# EasyEDA Pro project esp32s3clock.epro, board PCB2
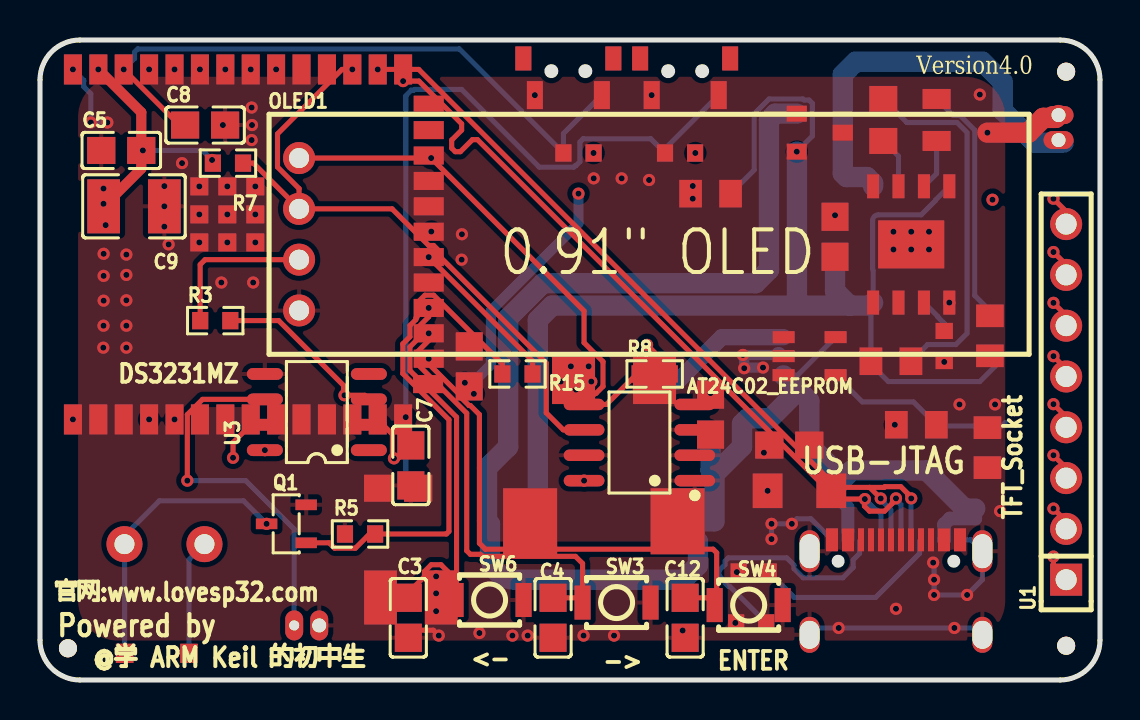
[diagram p7: board, top side]
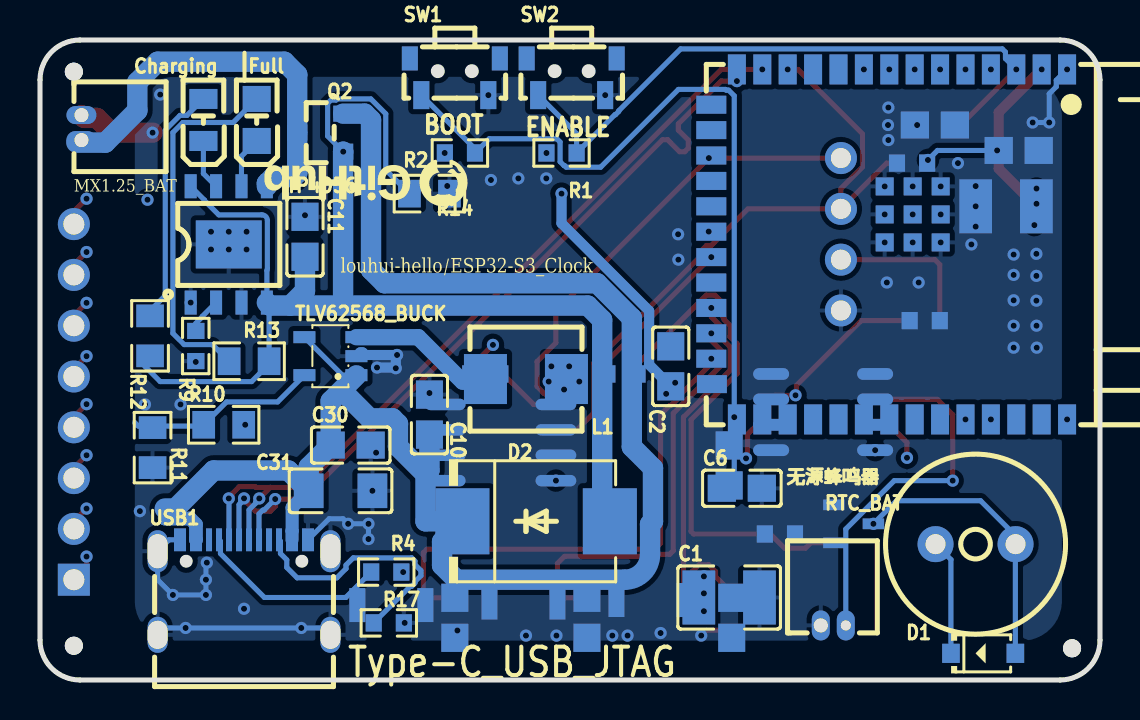
[diagram p8: board, bottom side, seen from below]

Outline 53 x 32 mm; copper layers: Top Layer, Inner1, Inner2, Bottom Layer. Coordinates in mm from the lower left corner of the outline.
Outline path: 0,30 0,2 arc(0.59,0.59) 2,0 51,0 arc(52.41,0.59) 53,2 53,30 arc(52.41,31.41) 51,32 2,32 arc(0.59,31.41) 0,30
Stack: Top Layer 0.035mm Outer layer thickness 1oz / Dielectric1 0.2104mm 7628 RC49% 8.6mil er 4.4 / Inner1 0.0152mm Inner layer thickness / Dielectric2 1.065mm 1.1mm H/HOZ Copper er 4.43 / Inner2 0.0152mm Inner layer thickness / Dielectric3 0.2104mm 7628 RC49% 8.6mil er 4.4 / Bottom Layer 0.035mm Outer layer thickness 1oz

## Design rules (mm)
net D+: DP1
net D-: DP1
spacing copperThickness1oz (default): track to track 0.102, other pairs 0.152 to 0.3
spacing copperThickness2oz: track to track 0.203, other pairs 0.152 to 0.3
track width copperThickness1oz (default): min 0.127, default 0.254, max 2.54
track width copperThickness2oz: min 0.203, default 0.254, max 2.54
differential pair differentialPair (default): width min 0.127, default 0.254, max 2.54; gap min 0.152, default 0.152
net GND uses copperRegion
net 3.3V uses copperRegion

## Placement (name value [footprint] x y rotation side)
AT24C02_EEPROM  AT24C02  [SOP-8_L5.0-W4.0-P1.27-LS6.0-BL]  29.97 11.87 90 top
C1  22uF  [C1210]  18.54 4.13 180 bottom
C2  100nF  [C0805]  21.46 15.68 90 bottom
C3  100nF  [C0805]  18.42 3.11 90 top
C4  100nF  [C0805]  25.65 3.11 90 top
C5  100nF  [C0805]  4.06 26.48 0 top
C6  100nF  [C0805]  17.91 9.59 180 bottom
C7  100nF  [C0805]  18.54 10.73 270 top
C8  100nF  [C0805]  8.26 27.75 0 top
C9  22uF  [C1210]  4.7 23.68 0 top
C10  10uF  [C0805]  33.53 13.27 270 bottom
C11  10uF  [C0805]  39.75 22.16 270 bottom
C12  100nF  [C0805]  32.26 3.11 90 top
C30  100nF  [C0805]  37.47 11.75 180 bottom
C31  22uF  [C1206]  37.97 9.46 180 bottom
Charging  GL0805UR01  [LED0805-R-RD_RED]  44.83 28 90 bottom
D1  1N4148W  [SOD-123_L2.7-W1.6-LS3.7-FD]  5.84 1.33 0 bottom
D2  SS34  [SMC_L6.9-W5.9-LS7.9-RD]  28.19 7.94 180 bottom
Full  GL0805UG01  [LED0805-FD_GL0805UG01]  42.16 28 270 bottom
L1  DH0520H-2R2M  [IND-SMD_L5.6-W5.2_MST0530H-150M]  28.7 15.05 0 bottom
MX1.25_BAT  ZX-MX1.25-2PWZ  [CONN-TH_2P-P1.25_ZX-MX1.25-2PWZ]  50.93 27.62 90 bottom
NOREF  -  [Pad_e538]  1.4 1.59 0 top
NOREF#2  -  [Pad_e539]  51.31 1.71 0 top
NOREF#3  -  [Pad_e540]  51.31 30.42 0 top
OLED1  HS91L02W2C01  [OLED-TH_L38.0-W12.0_HS91L02W2C01]  12.95 22.29 0 top
Q1  S8050  [SOT-23-3_L2.9-W1.3-P1.90-LS2.3-BR]  12.32 7.81 0 top
Q2  AO3401A  [SOT-23_L2.9-W1.3-P1.90-LS2.4-BR]  38.99 27.37 180 bottom
R1  10kΩ  [R0603]  26.92 26.35 180 bottom
R2  10kΩ  [R0603]  32 26.35 180 bottom
R3  10kΩ  [R0603]  8.76 17.97 0 top
R4  5.1kΩ  [R0603]  35.69 5.4 0 bottom
R5  10kΩ  [R0603]  16 7.3 0 top
R7  4.7kΩ  [R0603]  9.4 25.84 180 top
R8  4.7kΩ  [R0603]  30.73 15.3 0 top
R9  2.4kΩ  [R0603]  45.21 16.7 90 bottom
R10  100kΩ  [R0805]  43.82 12.76 180 bottom
R11  22kΩ  [R0805]  47.37 11.62 270 bottom
R12  1kΩ  [R0805]  47.5 17.21 270 bottom
R13  1kΩ  [R0805]  42.55 15.94 180 bottom
R14  100kΩ  [R0805]  33.53 24.32 0 bottom
R15  1kΩ  [R0603]  23.88 15.3 180 top
R17  5.1kΩ  [R0603]  35.56 2.86 0 bottom
RTC_BAT  ZX-MX1.25-2PWZ  [CONN-TH_2P-P1.25_ZX-MX1.25-2PWZ#2]  13.33 2.73 0 bottom
SW1  TS24CA 250gf 013  [SW-SMD_L4.7-W3.5-P3.35-EH]  32.26 30.16 180 bottom
SW2  TS24CA 250gf 013  [SW-SMD_L4.7-W3.5-P3.35-EH]  26.42 30.16 180 bottom
SW3  B3U-1000P  [KEY-SMD_B3U-1000PM]  28.83 3.87 0 top
SW4  B3U-1000P  [KEY-SMD_B3U-1000PM]  35.43 3.75 0 top
SW6  B3U-1000P  [KEY-SMD_B3U-1000PM]  22.48 4 0 top
TLV62568_BUCK  TLV62568DBVR  [SOT-23-5_L3.0-W1.7-P0.95-LS2.8-BR]  38.48 16.19 180 bottom
TP4056  TP4056  [ESOP-8_L4.9-W3.9-P1.27-LS6.0-BL-EP]  43.56 21.78 180 bottom
U1  LAIL-PM2.54-8P-L  [HDR-TH_LAIL-PM2.54-8P-L]  51.31 13.91 90 top
U2  2.4GHz  [WIRELM-SMD_ESP32-S3-WROOM-1]  10.54 21.78 270 bottom
U3  DS3231MZ+TRL  [SOIC-8_L4.9-W3.9-P1.27-LS6.0-BL]  13.84 13.4 90 top
USB1  LAIL-TYPE-C-16PIN-08-WT  [TYPE-C-SMD_LAIL-TYPE-C-16PIN-08-WT]  42.8 4.63 180 bottom
无源蜂鸣器  2.7kHz  [BUZ-TH_BD9.0-P4.00-D0.6-FD]  6.22 6.79 180 bottom

## Footprints (pads in the part's own frame, mm; a bottom-side part is the same pattern mirrored in y, then rotated)
BUZ-TH_BD9.0-P4.00-D0.6-FD
  round 1.8 hole 1: 1(-2,0) 2(2,0)
C0805
  rect 1.41x1.35 hole 0.001: 1(-1,0) 2(1,0)
C1206
  rect 1.485x1.728 hole 0.001: 1(-1.593,0) 2(1.593,0)
C1210
  rect 1.635x2.7 hole 0.001: 1(-1.518,0) 2(1.518,0)
CONN-TH_2P-P1.25_ZX-MX1.25-2PWZ
  oval 0.9x1.5 hole 0.7: 1(-0.625,0) 2(0.625,0)
CONN-TH_2P-P1.25_ZX-MX1.25-2PWZ#2
  oval 0.9x1.5 hole 0.5: 1(-0.625,0)
  oval 0.9x1.5 hole 0.7: 2(0.625,0)
ESOP-8_L4.9-W3.9-P1.27-LS6.0-BL-EP
  rect 0.6x1.2 hole 0.001: 1(-1.905,-2.909) 2(-0.635,-2.909) 3(0.635,-2.909) 4(1.905,-2.909) 5(1.905,2.909) 6(0.635,2.909) 7(-0.635,2.909) 8(-1.905,2.909)
  rect 3.3x2.4 hole 0.001: 9(0,0)
HDR-TH_LAIL-PM2.54-8P-L
  rect 1.6x1.6 hole 1.05: 1(-8.89,0)
  round 1.6 hole 1.05: 2(-6.35,0) 3(-3.81,0) 4(-1.27,0) 5(1.27,0) 6(3.81,0) 7(6.35,0) 8(8.89,0)
IND-SMD_L5.6-W5.2_MST0530H-150M
  rect 2.15x2.5 hole 0.001: 1(-2.025,0) 2(2.025,0)
KEY-SMD_B3U-1000PM
  rect 0.8x1.7 hole 0.001: 1(-1.7,0) 2(1.7,0)
LED0805-FD_GL0805UG01
  rect 1.3x1.399 hole 0.001: 1(-1.05,0) 2(1.05,0)
LED0805-R-RD_RED
  rect 1x1.399 hole 0.001: 1(1.05,0) 2(-1.05,0)
OLED-TH_L38.0-W12.0_HS91L02W2C01
  round 1.6 hole 1: 1(0,-3.81) 2(0,-1.27) 3(0,1.27) 4(0,3.81)
Pad_e538
  round 0.9 hole 1.7: 1(0,0)
Pad_e539
  round 0.9 hole 1.7: 1(0,0)
Pad_e540
  round 0.9 hole 1.7: 1(0,0)
R0603
  rect 0.806x0.864 hole 0.001: 1(-0.753,0) 2(0.753,0)
R0805
  rect 1.133x1.377 hole 0.001: 1(-1,0) 2(1,0)
SMC_L6.9-W5.9-LS7.9-RD
  rect 2.7x3.3 hole 0.001: 1(-3.687,0) 2(3.687,0)
SOD-123_L2.7-W1.6-LS3.7-FD
  rect 0.88x0.96 hole 0.001: 1(-1.61,0) 2(1.61,0)
SOIC-8_L4.9-W3.9-P1.27-LS6.0-BL
  oval 0.588x1.8 hole 0.001: 1(-1.905,-2.6) 2(-0.635,-2.6) 3(0.635,-2.6) 4(1.905,-2.6) 5(1.905,2.6) 6(0.635,2.6) 7(-0.635,2.6) 8(-1.905,2.6)
SOP-8_L5.0-W4.0-P1.27-LS6.0-BL
  oval 0.574x2.035 hole 0.001: 1(-1.905,-2.768) 2(-0.635,-2.768) 3(0.635,-2.768) 4(1.905,-2.768) 5(1.905,2.768) 6(0.635,2.768) 7(-0.635,2.768) 8(-1.905,2.768)
SOT-23-3_L2.9-W1.3-P1.90-LS2.3-BR
  rect 1.07x0.532 hole 0.001: 1(0.99,-0.95) 2(0.99,0.95) 3(-0.99,0)
SOT-23-5_L3.0-W1.7-P0.95-LS2.8-BR
  rect 1.1x0.6 hole 0.001: 1(1.3,-0.95) 2(1.3,0) 3(1.3,0.95) 4(-1.3,0.95) 5(-1.3,-0.95)
SOT-23_L2.9-W1.3-P1.90-LS2.4-BR
  rect 1x0.8 hole 0.001: 1(1.15,-0.95) 2(1.15,0.95) 3(-1.15,0)
SW-SMD_L4.7-W3.5-P3.35-EH
  rect 0.8x1.4 hole 0.001: 1(-1.675,-0.917) 2(1.675,-0.917)
  rect 0.8x1.2 hole 0.001: 3(-2.25,0.917) 4(2.25,0.917)
TYPE-C-SMD_LAIL-TYPE-C-16PIN-08-WT
  oval 1x2.1 hole 1x1.7: 13(4.32,1.805) 16(-4.32,1.805)
  oval 1x1.8 hole 1x1.4: 14(4.32,-2.375) 15(-4.32,-2.375)
  rect 0.6x1.14 hole 0.001: A1B12(-3.2,2.375) A4B9(-2.4,2.375) B1A12(3.2,2.375) B4A9(2.4,2.375)
  rect 0.3x1.14 hole 0.001: A5(-1.25,2.375) A6(-0.25,2.375) A7(0.25,2.375) A8(1.25,2.375) B5(1.75,2.375) B6(0.75,2.375) B7(-0.75,2.375) B8(-1.75,2.375)
WIRELM-SMD_ESP32-S3-WROOM-1
  rect 1.5x0.9 hole 0.001: 1(-8.75,8.895) 2(-8.75,7.625) 3(-8.75,6.355) 4(-8.75,5.085) 5(-8.75,3.815) 6(-8.75,2.545) 7(-8.75,1.275) 8(-8.75,0.005) 9(-8.75,-1.265) 10(-8.75,-2.535) 11(-8.75,-3.805) 12(-8.75,-5.075) 13(-8.75,-6.345) 14(-8.75,-7.615) 27(8.75,-7.615) 28(8.75,-6.345) 29(8.75,-5.075) 30(8.75,-3.805) 31(8.75,-2.535) 32(8.75,-1.265) 33(8.75,0.005) 34(8.75,1.275) 35(8.75,2.545) 36(8.75,3.815) 37(8.75,5.085) 38(8.75,6.355) 39(8.75,7.625) 40(8.75,8.895)
  rect 0.9x1.5 hole 0.001: 15(-6.985,-8.895) 16(-5.715,-8.895) 17(-4.445,-8.895) 18(-3.175,-8.895) 19(-1.905,-8.895) 20(-0.635,-8.895) 21(0.635,-8.895) 22(1.905,-8.895) 23(3.175,-8.895) 24(4.445,-8.895) 25(5.715,-8.895) 26(6.985,-8.865)
  rect 0.9x0.9 hole 0.001: 41(-2.9,-0.225) 41(-2.9,1.175) 41(-2.9,2.575) 41(-1.5,-0.225) 41(-1.5,1.175) 41(-1.5,2.575) 41(-0.1,-0.225) 41(-0.1,1.175) 41(-0.1,2.575)

## Nets
As in the schematic.

Pads without a net: NOREF 1; NOREF#2 1; NOREF#3 1; SW1 3 4; SW2 3 4; U2 10 11 15 16 18 19 22 26 28 29 30 31 32 33 34 35 38 39; U3 1 4; USB1 A8 B8

## Via types
v1: diameter 0.61, hole 0.305, Top Layer to Bottom Layer, 143 vias

## Routing (per net, layer and track width the routed paths; a pad name or vN(x,y) marks a point on that pad's centre or on a via; arc(x,y) is an arc through that point)
3.3V: length 51.4
  Top Layer w0.254: OLED1.2 8.26,21.02 8.01,20.77 R3.1 ; v1(50.67,21.4) 51.31,20.76 U1.7 ; 17.75,11.08 17.89,11.08 C7.1 ; 17.75,11.08 17.62,11.21 17.62,12.29 17.14,12.76 U3.2 ; 17.75,11.08 v1(17.7,11.08) ; v1(3.28,22.75) 3.28,23.7 v1(3.18,23.81) v1(3.18,24.57) ; 31.37,15.17 31.37,15.74 v1(30.35,16.76)
  Top Layer w0.508: C9.1 3.24,23.74 5.06,25.57 C5.2 5.06,28.38 v1(2.92,30.53)
  Inner2 w0.254: v1(47.63,24.01) 47.85,23.79 48.79,23.79 49.18,23.4 49.18,22.46 49.42,22.22 49.59,22.22 50.42,21.4 v1(50.67,21.4)
  Bottom Layer w0.254: D1.2 7.45,6.02 无源蜂鸣器.1 ; v1(8.6,26) 8.13,26.48 v1(5.14,26.48)
  Bottom Layer w0.508: v1(26.92,24.32) 26.92,22.84 22.54,18.46 22.54,15.76 C2.1
  vias: v1(19.81,5.18) v1(19.81,4.33) v1(19.81,3.44) v1(21.24,14.86) v1(21.69,14.31) v1(26.04,14.92) v1(26.54,15.68) v1(26.8,14.52) v1(27.2,9.97) v1(27.43,15.68) v1(27.57,14.92) v1(27.68,26.35) v1(32.77,26.35) v1(42.74,12.76)
GND: length 39.7
  Top Layer w0.254: v1(19.94,2.22) 19.67,2.49 18.54,2.49 ; v1(50.67,24.07) 51.31,23.43 U1.8
  Top Layer w1.016: MX1.25_BAT.2 50.79,28.11 50.17,28.11 49.43,27.37 v1(47.37,27.37)
  Inner2 w0.254: v1(47.37,27.37) v1(50.67,24.07)
  Bottom Layer w0.254: USB1.15 46.78,2.6 v1(45.72,2.6) v1(39.94,2.6) 38.82,2.6 USB1.14 ; v1(1.65,30.53) 2.19,29.99 2.19,29.66 2.54,29.31 v1(2.54,27.88) v1(3.37,27.88) ; v1(36.58,7.05) v1(36.58,7.81) v1(37.59,7.81) 37.85,8.06 38.55,8.06 USB1.B1A12 ; v1(44.66,5.87) 44.7,5.82 v1(44.7,5.02) v1(44.7,4.25) v1(46.36,4.25) 47.12,5.02 USB1.16 46.55,7.01 USB1.A1B12
  Bottom Layer w0.508: v1(36.15,15.62) 35.24,15.62 v1(35.21,15.59) 35.21,16.19 v1(35.15,16.25) 36.74,16.25 36.86,16.38 36.99,16.38 TLV62568_BUCK.2
  vias: v1(1.65,13.03) v1(3.18,21.31) v1(3.18,20.21) v1(3.18,18.97) v1(3.18,17.72) v1(3.16,16.62) v1(4.32,21.27) v1(4.32,20.26) v1(4.32,18.98) v1(4.32,17.72) v1(4.32,16.62) v1(6.22,24.69) v1(6.22,23.68) v1(6.22,22.67) v1(6.43,21.78) v1(7.1,25.84) v1(7.97,24.68) v1(7.97,23.28) v1(7.97,21.88) v1(9.14,27.75) v1(9.07,19.87) v1(9.37,24.68) v1(9.37,23.28) v1(9.37,21.88) v1(10.58,28.62) v1(10.6,27.75) v1(10.58,27) v1(10.66,19.87) v1(10.77,24.68) v1(10.77,23.28) v1(10.77,21.88) v1(21.1,22.29) v1(21.08,21.02) v1(21.97,2.35) v1(23.62,2.22) v1(24.38,2.22) v1(24.74,29.24) v1(27.18,2.22) v1(27.69,25.08) v1(28.7,2.22) v1(29.08,25.08) v1(30.45,25) v1(30.58,29.24) v1(32.13,2.48) v1(32.64,24.7) v1(32.64,24.07) v1(33.53,14.35) v1(34.84,5.4) v1(34.77,2.86) v1(36.2,11.37) v1(36.38,9.46) v1(39.75,23.24) v1(42.67,22.41) v1(42.67,21.53) v1(42.8,3.56) v1(43.56,22.41) v1(43.56,21.53) v1(44.45,22.41) v1(44.45,21.53) v1(45.21,15.9) v1(45.47,18.87) v1(45.97,13.78) v1(46.99,29.27) v1(47.75,13.78) v1(48.01,8.44)
VBUS: length 67.1
  Bottom Layer w0.254: 47.75,16.21 47.75,15.68 46.99,14.92 42.42,14.92 41.55,15.79 R13.2 41.55,18.76 ; TP4056.4 41.66,20.47 arc(41.64,20.52) 41.63,20.58 41.63,22.98 arc(41.71,23.18) 41.91,23.26 44.06,23.26 44.78,23.97 44.78,24 TP4056.8 ; v1(37.84,26.42) 38.62,27.2 38.62,28.83 38.45,29 38.2,29 38.14,29.05 36.46,29.05 35.71,28.31 35.71,25.5 R14.2
  Bottom Layer w1.016: 40.48,18.72 39.75,19.45 C11.2 ; 40.48,18.72 25.61,18.72 24.89,18 24.89,8.32 D2.2 ; 40.48,18.72 41.51,18.72 41.55,18.76 TP4056.4 ; 37.85,18.98 37.85,26.41 v1(37.84,26.42)
VIN: length 86.3
  Bottom Layer w0.254: TLV62568_BUCK.1 37.88,15.24 TLV62568_BUCK.4
  Bottom Layer w0.65: USB1.B4A9 40.4,7.45 40.39,7.45 40.39,8.63 C31.1
  Bottom Layer w0.686: 46.76,8.57 46.76,8.07 45.49,8.07 45.2,7.78 45.2,7.01 USB1.A4B9
  Bottom Layer w1.016: 33.72,10.29 33.53,10.49 C10.2 ; 33.72,10.29 35.1,11.67 35.1,12.81 35.37,13.08 36.51,13.08 37.72,14.29 ; 33.72,10.29 33.72,7.94 D2.1 32.9,6.92 32.9,5.73 32.18,5.02 23.77,5.02 arc(22.87,5.39) 22.5,6.29 22.5,7.79 22.35,7.94 22.35,10.6 23.41,11.66 23.41,18.1 25.15,19.84 35.78,19.84 36.45,20.51 36.45,28 36.76,28.32 Q2.2 ; 37.18,15.23 38.47,13.95 C30.1 39.57,10.65 C31.1 40.58,10.48 44.32,10.48 46.23,8.57 46.76,8.57
BAT_IN: length 18.7
  Top Layer w0.254: v1(7.37,9.97) 7.37,13.27 8.13,14.03 U3.6
  Bottom Layer w0.254: v1(7.37,9.97) 10.29,9.97 12.71,7.55 RTC_BAT.1
BL: length 77
  Top Layer w0.254: U1.1 50.67,5.65 v1(50.67,6.17)
  Inner2 w0.254: v1(50.67,6.17) 50.5,6.35 50.23,6.35 49.59,6.98 49.59,9.02 38.73,19.88 24.58,19.88 20.17,15.47 20.17,15.15 19.78,14.77 18.09,14.77 13.5,10.17 8.76,10.17 6.14,12.79 6.14,13.27 5.63,13.78 5.63,24.94 6.16,25.47 6.16,26.23 6.37,26.44 6.37,30.06 5.9,30.53 v1(5.46,30.53)
BOOT: length 40
  Bottom Layer w0.254: C6.1 18.29,10.21 v1(18.29,13.14) 18.29,29.21 18.57,29.49 18.69,29.49 18.73,29.53 21.08,29.53 24.97,25.64 26.69,25.64 26.77,25.72 26.8,25.72 27,25.91 27,26.9 27.16,27.06 30.54,27.06 R2.2 31.25,26.56 SW1.1
BUZZER: length 14.4
  Bottom Layer w0.254: D1.1 4.23,6.78 4.01,7 5.97,8.96 10.18,8.96 v1(11.33,7.81)
BUZZER_PWM: length 26.6
  Top Layer w0.254: R15.2 23.12,15.8 19.69,19.24 19.25,19.24 18.85,18.85 18.85,18.15 18.8,18.1 18.8,18.02 18.5,17.72 18.5,17.16 18.14,16.81 18.14,15.32 20.45,13.02 20.45,7.43 20.32,7.3 R5.2 16.48,7.3 15.77,6.59 14.73,6.59 14.46,6.86 Q1.1
CLK: length 48.2
  Top Layer w0.254: U1.6 51.31,18.22 v1(50.67,18.86)
  Inner2 w0.254: 50.67,17.59 48.82,19.44 48.82,23.25 48.64,23.43 40.38,23.43 39.99,23.82 39.51,23.82 39.12,23.43 21.34,23.43 14.24,30.53 v1(11.81,30.53)
CS: length 77.9
  Top Layer w0.254: U1.2 51.31,7.94 v1(50.67,8.57)
  Inner2 w0.254: v1(6.73,30.53) 6.73,26.29 6.52,26.09 6.52,25.6 7.02,25.11 7.02,13.71 9.07,11.66 9.07,10.87 9.41,10.53 11.1,10.53 11.83,11.25 11.83,11.6 13.93,13.7 14.69,12.94 15.76,12.94 17.94,15.12 19.63,15.12 19.81,15.3 19.81,15.61 21.64,17.44 21.64,20.03 22.5,20.89 40.64,20.89 41.64,19.9 42.94,19.9 46.81,16.02 46.81,12.3 50.54,8.57 v1(50.67,8.57)
D+: length 40.6
  Top Layer w0.254: v1(42.8,9.08) 42.62,8.9 42.62,8.84 42.23,8.44 41.48,8.44 41.22,8.7 41.22,9.03 v1(41.24,9.05) 39.84,9.05 21.87,27.02 21.62,27.02 21.02,26.41 20.76,26.41 20.58,26.59 20.58,27 21.08,27.49 21.08,27.81 18.95,29.95 v1(18.16,29.95)
  Bottom Layer w0.254: USB1.A6 43.05,8.77 42.98,8.84 42.98,8.9 v1(42.8,9.08) ; v1(41.24,9.05) 41.8,8.49 41.86,8.49 42.05,8.31 USB1.B6
D-: length 40.8
  Top Layer w0.254: 41.48,9.63 42.21,9.63 42.24,9.67 43.04,9.67 43.38,9.32 43.38,9.26 v1(43.56,9.08) ; 41.48,9.63 39.83,9.63 18.94,30.53 v1(16.89,30.53) ; 41.48,9.63 v1(42.04,9.08)
  Bottom Layer w0.254: USB1.B7 43.55,9.07 v1(43.56,9.08) ; v1(42.04,9.08) 42.22,8.9 42.22,8.84 42.55,8.51 USB1.A7
DC: length 75.7
  Top Layer w0.254: U1.3 51.31,10.6 v1(50.67,11.24)
  Inner2 w0.254: v1(50.67,11.24) 50.04,11.24 49.24,12.04 49.24,14.71 47.17,16.77 47.17,20.08 46.99,20.26 41.78,20.26 40.77,21.27 22.16,21.27 21.32,20.43 20.24,20.43 17.14,17.33 16.96,17.33 16.16,16.54 16.16,13.85 15.61,13.3 14.83,13.3 14.28,13.85 14.28,17.91 14.16,18.03 14.16,18.29 18.03,22.16 18.03,23.3 18.48,23.75 18.48,24 13.54,28.94 11.38,28.94 10.74,29.59 9.38,29.59 8.44,30.53 v1(8,30.53)
DS_WAKE_UP_GPIO12: length 18.8
  Top Layer w0.254: R3.2 11.94,17.97 15.18,14.73 15.18,14.28 v1(15.22,14.24) 16.24,14.24 U3.3
  Inner2 w0.254: v1(19.57,22.42) 15.22,18.08 v1(15.22,14.24)
FB: length 9.6
  Bottom Layer w0.254: 48.26,12.87 48.08,12.7 44.88,12.7 R10.1 43.67,13.91 41.12,13.91 TLV62568_BUCK.5
KEY_ENTER: length 26.7
  Top Layer w0.254: C12.2 33.37,4.11 SW4.1 33.83,3.85 33.83,6.36 33.66,6.54 22.27,6.54 21.97,6.84 21.97,13.27 21.52,13.72 21.45,13.72 21.11,14.07 21.11,14.13 19.44,15.81 v1(19.44,16.06)
KEY_LEFT: length 20.1
  Top Layer w0.254: 20.87,4.09 20.83,4.13 20.83,13.14 18.5,15.48 18.5,16.66 18.85,17.01 18.85,17.58 19.44,18.16 v1(19.44,18.6) ; SW6.1 20.39,4.39 20.39,5.42 20.05,5.76 19.56,5.76 19.22,5.42 19.22,5.17 18.54,4.49
KEY_RIGHT: length 21.7
  Top Layer w0.254: v1(19.44,17.33) 19.44,16.98 18.85,16.39 18.85,15.82 21.34,13.34 21.34,6.46 21.52,6.29 22.02,6.29 22.12,6.18 26.77,6.18 27.13,5.83 SW3.1 26.89,4.11 C4.2
LED: length 2.5
  Bottom Layer w0.254: Charging.2 44.83,25.32 TP4056.7
LED1: length 2.6
  Bottom Layer w0.254: Full.2 42.93,26.19 TP4056.6
LED_VCC: length 12.3
  Bottom Layer w0.254: 47.75,18.21 46.74,19.22 46.74,27.49 46,28.23 45.65,28.23 Charging.1
LED_VCC1: length 18.3
  Bottom Layer w0.254: R13.1 44.38,16.77 45.79,16.77 46.36,17.33 46.36,27.37 45.85,27.88 43.34,27.88 Full.1
MOSI: length 50
  Top Layer w0.254: U1.5 51.31,15.56 v1(50.67,16.19)
  Inner2 w0.254: v1(50.67,16.19) 50.54,16.19 48.46,18.27 48.46,22.34 48.01,22.8 44.89,22.8 44.69,23 42.43,23 42.23,22.8 40.13,22.8 39.99,22.65 39.51,22.65 39.16,23.01 20.74,23.01 14.1,29.65 11.86,29.65 10.98,30.53 v1(10.54,30.53)
POWER_BAT_IN: length 20.6
  Bottom Layer w1.016: TP4056.5 41.66,24.83 41.34,25.15 40.33,25.15 40.14,25.34 Q2.3 40.14,30.27 40.78,30.91 47.12,30.91 48.13,29.9 48.13,28.47 49.73,26.87 51.18,26.87
RES: length 73
  Top Layer w0.254: v1(50.67,13.79) 51.31,13.16 U1.4
  Inner2 w0.254: v1(9.27,30.53) 9.71,30.53 10.29,29.95 10.88,29.95 11.43,29.4 11.61,29.4 11.71,29.3 13.95,29.3 19.43,23.81 19.43,23.56 18.63,22.75 18.63,21.99 14.87,18.23 14.87,14.71 14.64,14.48 14.64,13.99 14.98,13.65 15.47,13.65 15.81,13.99 15.81,16.69 20.82,21.7 41.1,21.7 41.78,21.02 42.35,21.02 42.43,20.94 44.69,20.94 44.77,21.02 47.24,21.02 47.75,20.51 47.75,16.71 49.59,14.87 49.59,14.6 50.23,13.97 50.5,13.97 v1(50.67,13.79)
RST: length 32.7
  Top Layer w0.254: C8.1 6.97,27.75 v1(4.19,30.53)
  Bottom Layer w0.254: SW2.1 26.17,27.32 R1.2 24.26,28.26 24.23,28.26 24.06,28.43 24.06,28.46 20.96,31.56 4.89,31.56 4.73,31.39 4.73,31.07 v1(4.19,30.53)
RX:
  vias: v1(6.73,13.03)
SCL: length 46.2
  Top Layer w0.254: OLED1.3 10.67,25.84 R7.1 ; OLED1.3 12.95,24.57 11.88,25.65 11.88,27.3 15.1,30.53 v1(15.62,30.53) ; OLED1.3 17.6,23.56 19.43,21.73 19.68,21.73 20.02,21.39 20.02,21.14 25.31,15.85 25.31,13.36 26.16,12.51 AT24C02_EEPROM.6
  Inner2 w0.254: OLED1.3 11.35,21.95 11.35,21.64 11.24,21.53 v1(11.24,11.49)
SDA: length 45.8
  Top Layer w0.254: v1(9.65,11.11) 9.65,11.87 10.54,12.76 U3.7 ; 30.1,15.56 28.32,13.78 AT24C02_EEPROM.5 27.76,14.34 27.81,14.34 28.15,14.68 28.15,15.92 27.2,16.86 27.2,18.45 v1(19.56,26.1) OLED1.4
  Inner2 w0.254: OLED1.4 11.35,24.49 11.35,24.44 11.01,24.1 10.95,24.1 10.72,23.86 10.52,23.86 10.18,23.52 10.18,21.87 9.65,21.34 v1(9.65,11.11)
TX:
  vias: v1(5.46,13.03)
$1N30: length 8
  Top Layer w0.254: R15.1 24.63,15.95 v1(19.44,21.14)
$1N47: length 6.5
  Bottom Layer w0.813: TLV62568_BUCK.3 34.09,17.14 31.87,14.92 31.62,14.92
$1N62: length 13
  Bottom Layer w0.254: R17.2 34.48,4.69 34.42,4.69 34.25,4.85 34.25,4.92 33.95,5.22 33.95,5.47 34.25,5.77 34.25,5.94 34.42,6.11 37.34,6.11 37.7,5.75 37.7,5.57 38.16,5.11 40.14,5.11 40.66,5.63 40.66,6.01 40.98,6.32 40.98,6.94 USB1.B5
$1N63: length 9.7
  Bottom Layer w0.254: R4.2 37.71,4.13 41.78,4.13 43.98,6.32 43.98,6.94 USB1.A5
$3N15: length 1.8
  Bottom Layer w0.254: TP4056.2 44.89,18.18 44.89,18.16 45.21,17.83 R9.2

## Copper pours and planes (outline as drawn; the poured copper is in the pictures)
3.3V on Inner2: 1.91,28.16 1.93,28.45 1.99,28.72 2.09,28.99 2.22,29.24 2.39,29.47 2.6,29.67 2.82,29.84 3.07,29.98 3.34,30.08 3.62,30.14 3.91,30.16 46.26,30.16 46.54,30.14 46.82,30.08 47.09,29.98 47.34,29.84 47.57,29.67 47.77,29.47 47.94,29.24 48.08,28.99 48.18,28.72 48.24,28.45 48.26,28.16 48.26,3.97 48.24,3.68 48.18,3.4 48.08,3.14 47.94,2.89 47.77,2.66 47.57,2.46 47.34,2.28 47.09,2.15 46.82,2.05 46.54,1.99 46.26,1.97 3.91,1.97 3.62,1.99 3.34,2.05 3.07,2.15 2.82,2.28 2.6,2.46 2.39,2.66 2.22,2.89 2.09,3.14 1.99,3.4 1.93,3.68 1.91,3.97
GND on Top Layer: 1.91,28.16 1.93,28.45 1.99,28.72 2.09,28.99 2.22,29.24 2.39,29.47 2.6,29.67 2.82,29.84 3.07,29.98 3.34,30.08 3.62,30.14 3.91,30.16 46.26,30.16 46.54,30.14 46.82,30.08 47.09,29.98 47.34,29.84 47.57,29.67 47.77,29.47 47.94,29.24 48.08,28.99 48.18,28.72 48.24,28.45 48.26,28.16 48.26,3.97 48.24,3.68 48.18,3.4 48.08,3.14 47.94,2.89 47.77,2.66 47.57,2.46 47.34,2.28 47.09,2.15 46.82,2.05 46.54,1.99 46.26,1.97 3.91,1.97 3.62,1.99 3.34,2.05 3.07,2.15 2.82,2.28 2.6,2.46 2.39,2.66 2.22,2.89 2.09,3.14 1.99,3.4 1.93,3.68 1.91,3.97
GND on Bottom Layer: 1.91,28.16 1.93,28.45 1.99,28.72 2.09,28.99 2.22,29.24 2.39,29.47 2.6,29.67 2.82,29.84 3.07,29.98 3.34,30.08 3.62,30.14 3.91,30.16 46.26,30.16 46.54,30.14 46.82,30.08 47.09,29.98 47.34,29.84 47.57,29.67 47.77,29.47 47.94,29.24 48.08,28.99 48.18,28.72 48.24,28.45 48.26,28.16 48.26,3.97 48.24,3.68 48.18,3.4 48.08,3.14 47.94,2.89 47.77,2.66 47.57,2.46 47.34,2.28 47.09,2.15 46.82,2.05 46.54,1.99 46.26,1.97 3.91,1.97 3.62,1.99 3.34,2.05 3.07,2.15 2.82,2.28 2.6,2.46 2.39,2.66 2.22,2.89 2.09,3.14 1.99,3.4 1.93,3.68 1.91,3.97
GND on Inner1: 1.91,28.16 1.93,28.45 1.99,28.72 2.09,28.99 2.22,29.24 2.39,29.47 2.6,29.67 2.82,29.84 3.07,29.98 3.34,30.08 3.62,30.14 3.91,30.16 46.26,30.16 46.54,30.14 46.82,30.08 47.09,29.98 47.34,29.84 47.57,29.67 47.77,29.47 47.94,29.24 48.08,28.99 48.18,28.72 48.24,28.45 48.26,28.16 48.26,3.97 48.24,3.68 48.18,3.4 48.08,3.14 47.94,2.89 47.77,2.66 47.57,2.46 47.34,2.28 47.09,2.15 46.82,2.05 46.54,1.99 46.26,1.97 3.91,1.97 3.62,1.99 3.34,2.05 3.07,2.15 2.82,2.28 2.6,2.46 2.39,2.66 2.22,2.89 2.09,3.14 1.99,3.4 1.93,3.68 1.91,3.97

## Text on the board
Bottom Silkscreen Layer: ENABLE | BOOT | | | Type-C_USB_JTAG | louhui-hello/ESP32-S3_Clock
Top Silkscreen Layer: DS3231MZ | <- | -> | ENTER | TFT_Socket | Powered by | USB-JTAG | 0.91" OLED | @学 ARM Keil 的初中生 | Version4.0 | 官网:www.lovesp32.com
